# Altium schematic sheet Sheet1.SchDoc
size B; DrawnBy: DMK; Revision: A; SheetNumber: 1; SheetTotal: 1
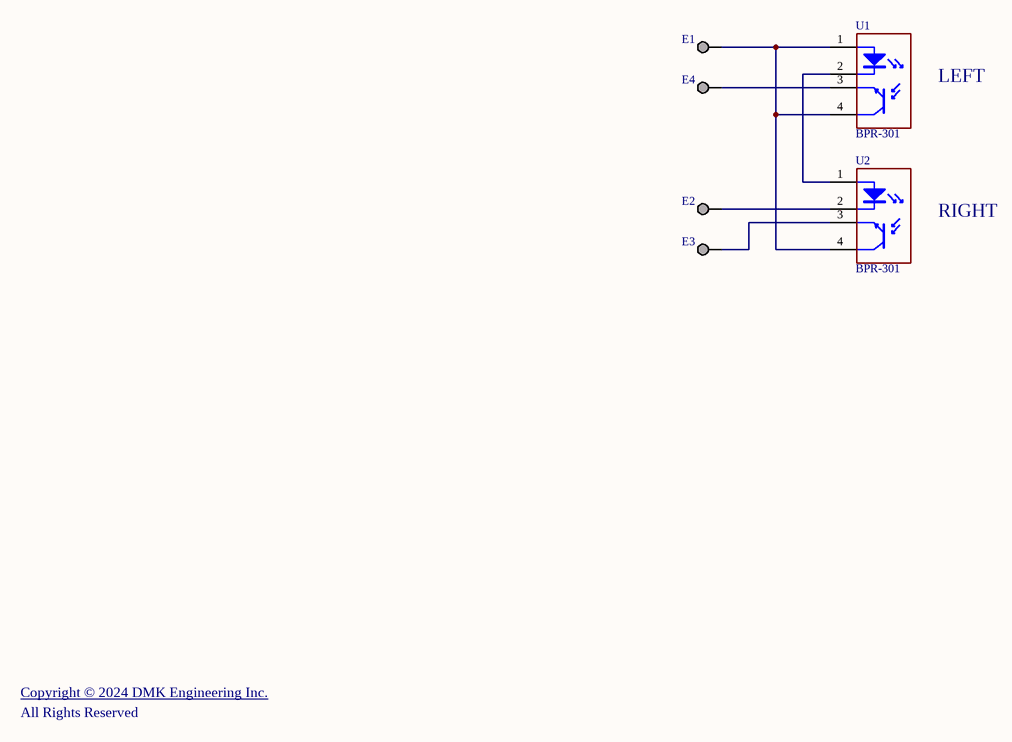
[diagram p0: Sheet1.SchDoc]

## Parts
E1  PAD  [PAD 1.0 x 2.7 mm]  (value not drawn)
E2  PAD  [PAD 1.0 x 2.7 mm]  (value not drawn)
E3  PAD  [PAD 1.0 x 2.7 mm]  (value not drawn)
E4  PAD  [PAD 1.0 x 2.7 mm]  (value not drawn)
U1  BPR-301  [BPR-301]
U2  BPR-301  [BPR-301]

## Nets
NetE1_1: E1.1 U1.1(CATHODE) U1.4(EMITTER) U2.4(EMITTER)
NetE2_1: E2.1 U2.2(ANODE)
NetE3_1: E3.1 U2.3(COLLECTOR)
NetE4_1: E4.1 U1.3(COLLECTOR)
NetU1_2: U1.2(ANODE) U2.1(CATHODE)

## Notes on the sheet
- LEFT
- RIGHT
- Copyright © 2024 DMK Engineering Inc. <www.dmkeng.com>
- All Rights Reserved

## Library data of the parts
E1-E4 = TEST POINT: Part of PCB
U1 U2 = BPR-301: Sensor Opt Reflective Module; Manufacturer: American Bright; Output Configuration: NPN - Open Collector; Operating Supply Current: 50mA; Supplier 1: Digikey; Supplier Part Number 1: BPR-301-ND; Manufacturer Part Number: BPR-301; RoHS: Yes; Stock 1: 12121; Pricing 1: 1=1.8, 10=1.391, 100=1.0302, 1000=0.7984, 5000=0.7469, 10000=0.69539 (USD); Mounting Technology: Through Hole; Case/Package: Module; Packaging: Bulk; Series: -; RoHS Compliant: Yes; ComponentLink1URL: http://www.americanbrightled.com/pdffiles/infrared/BPR-301.pdf?src-supplier=Digikey; ComponentLink1Description: http://www.americanbrightled.com/pdffiles/infrared/BPR-301.pdf?src-supplier=Digikey